# Altium schematic sheet FORMULA.SchDoc
size A4; SheetNumber: 4; SheetTotal: 8
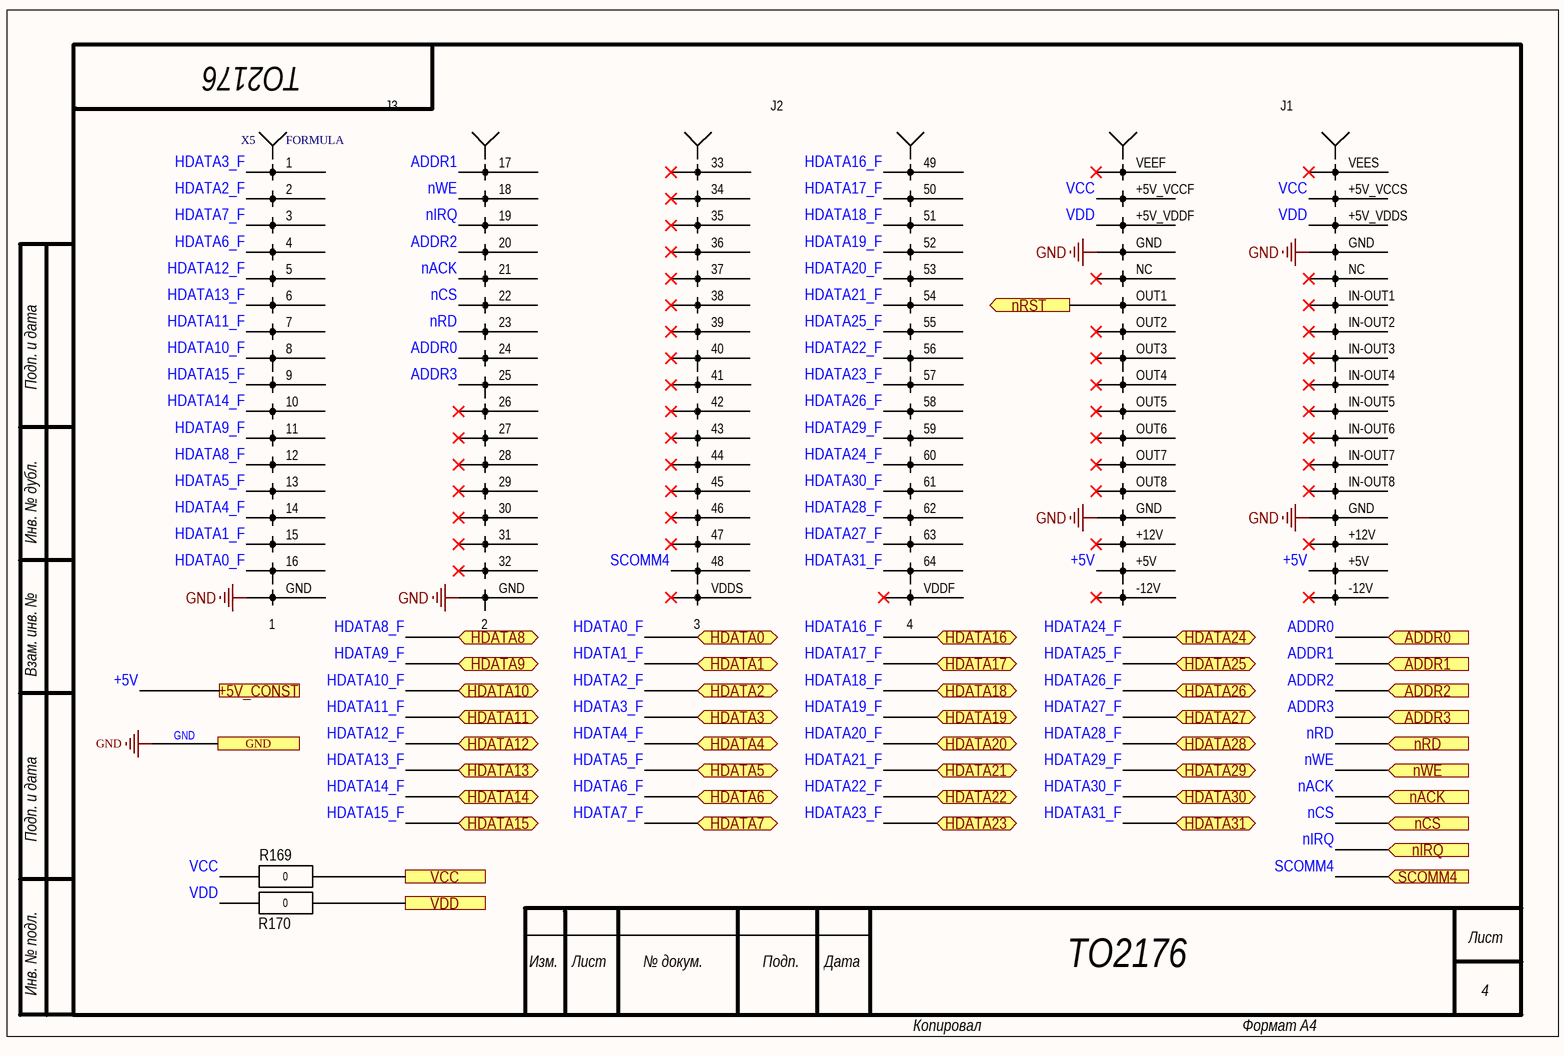
[diagram p0: FORMULA.SchDoc]

## Parts
R169  0  [0603]
R170  0  [0603]
X5  FORMULA  [FORMULA]

## Ports
+5V_CONST, ADDR0 (in), ADDR1 (in), ADDR2 (in), ADDR3 (in), GND, HDATA0 (bidir), HDATA1 (bidir), HDATA2 (bidir), HDATA3 (bidir), HDATA4 (bidir), HDATA5 (bidir), HDATA6 (bidir), HDATA7 (bidir), HDATA8 (bidir), HDATA9 (bidir), HDATA10 (bidir), HDATA11 (bidir), HDATA12 (bidir), HDATA13 (bidir), HDATA14 (bidir), HDATA15 (bidir), HDATA16 (bidir), HDATA17 (bidir), HDATA18 (bidir), HDATA19 (bidir), HDATA20 (bidir), HDATA21 (bidir), HDATA22 (bidir), HDATA23 (bidir), HDATA24 (bidir), HDATA25 (bidir), HDATA26 (bidir), HDATA27 (bidir), HDATA28 (bidir), HDATA29 (bidir), HDATA30 (bidir), HDATA31 (bidir), nACK (in), nCS (in), nIRQ (in), nRD (in), nRST (out), nWE (in), SCOMM4 (in), VCC, VDD

## Nets
GND: X5.GND ; port GND
+5V: X5.+5V ; port +5V_CONST
ADDR0: X5.24 ; port ADDR0
ADDR1: X5.17 ; port ADDR1
ADDR2: X5.20 ; port ADDR2
ADDR3: X5.25 ; port ADDR3
HDATA0_F: X5.16 ; port HDATA0
HDATA1_F: X5.15 ; port HDATA1
HDATA2_F: X5.2 ; port HDATA2
HDATA3_F: X5.1 ; port HDATA3
HDATA4_F: X5.14 ; port HDATA4
HDATA5_F: X5.13 ; port HDATA5
HDATA6_F: X5.4 ; port HDATA6
HDATA7_F: X5.3 ; port HDATA7
HDATA8_F: X5.12 ; port HDATA8
HDATA9_F: X5.11 ; port HDATA9
HDATA10_F: X5.8 ; port HDATA10
HDATA11_F: X5.7 ; port HDATA11
HDATA12_F: X5.5 ; port HDATA12
HDATA13_F: X5.6 ; port HDATA13
HDATA14_F: X5.10 ; port HDATA14
HDATA15_F: X5.9 ; port HDATA15
HDATA16_F: X5.49 ; port HDATA16
HDATA17_F: X5.50 ; port HDATA17
HDATA18_F: X5.51 ; port HDATA18
HDATA19_F: X5.52 ; port HDATA19
HDATA20_F: X5.53 ; port HDATA20
HDATA21_F: X5.54 ; port HDATA21
HDATA22_F: X5.56 ; port HDATA22
HDATA23_F: X5.57 ; port HDATA23
HDATA24_F: X5.60 ; port HDATA24
HDATA25_F: X5.55 ; port HDATA25
HDATA26_F: X5.58 ; port HDATA26
HDATA27_F: X5.63 ; port HDATA27
HDATA28_F: X5.62 ; port HDATA28
HDATA29_F: X5.59 ; port HDATA29
HDATA30_F: X5.61 ; port HDATA30
HDATA31_F: X5.64 ; port HDATA31
nACK: X5.21 ; port nACK
nCS: X5.22 ; port nCS
nIRQ: X5.19 ; port nIRQ
nRD: X5.23 ; port nRD
nRST: X5.OUT1 ; port nRST
nWE: X5.18 ; port nWE
SCOMM4: X5.48 ; port SCOMM4
VCC: R169.1 X5.+5V_VCCF(VCCF) X5.+5V_VCCS(VCCS)
VCC: R169.2 ; port VCC  [a separate net that carries the same name]
VDD: R170.1 X5.+5V_VDDF(VDDF) X5.+5V_VDDS(VDDS)
VDD: R170.2 ; port VDD  [a separate net that carries the same name]

Not connected (* = marked no-connect by the designer): X5 26* 27* 28* 29* 30* 31* 32* 33* 34* 35* 36(4)* 37(5)* 38* 39* 40* 41* 42* 43* 44* 45* 46* 47* +12V* -12V* IN-OUT1* IN-OUT2* IN-OUT3* IN-OUT4* IN-OUT5* IN-OUT6* IN-OUT7* IN-OUT8* NC* OUT2* OUT3* OUT4* OUT5* OUT6* OUT7* OUT8* VDDF* VDDS* VEEF* VEES*

## Notes on the sheet
- ТО2176
- Подп. и дата
- Инв. № дубл.
- Взам. инв. №
- Инв. № подл.
- Изм.
- Лист
- № докум.
- Подп.
- Дата
- 4
- Копировал
- Формат А4
- (in symbol FORMULA) J3; J2; J1

## Library data of the parts
R169 R170 = R0603 Yageo: ComponentHeigt: 0.5; Leadform: SMD; Firme: Yageo; Kind: Резистор; Packaging: 0402; ClassName: *; Component Link: *; NN: *